# Altium schematic sheet CW341_SRAM.SchDoc: CW341 SRAM
size Letter; Organization: NewAE Technology Inc.; Address1: 1083 Queen St., Suite 196; Address2: Halifax; Address3: NS; Address4: Canada B3H 0B2; SheetNumber: 13; SheetTotal: 15; SheetApproved: NO
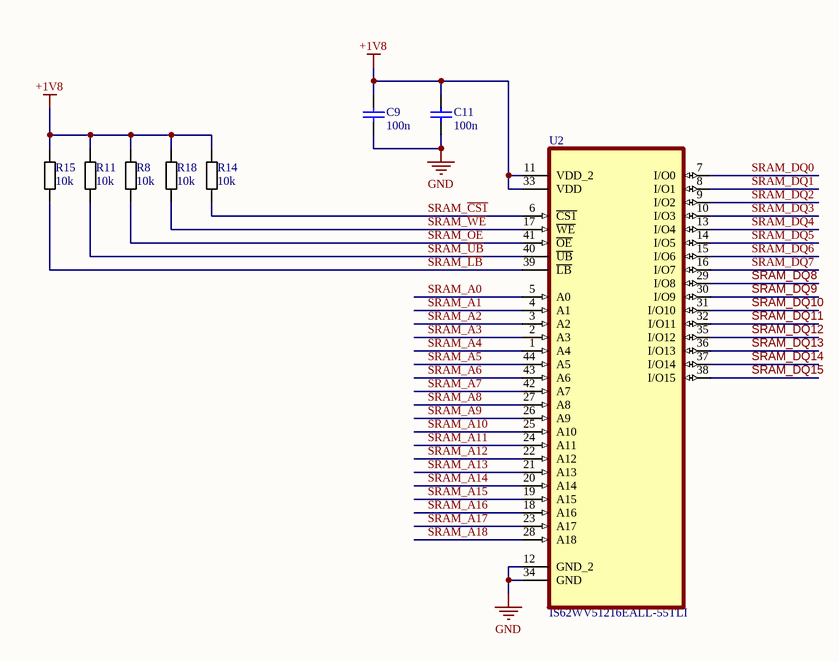
[diagram p0: CW341_SRAM.SchDoc]

## Parts
C9  100n  [CAPC0402_M]
C11  100n  [CAPC0402_M]
R8  10k  [RESC1005X40N]
R11  10k  [RESC1005X40N]
R14  10k  [RESC1005X40N]
R15  10k  [RESC1005X40N]
R18  10k  [RESC1005X40N]
U2  SRAM - 8Mb (1M x 8) Parallel  55ns 44-TSOP II  [TSOP80P1180X120-44M]  (value not drawn)

## Nets
+1V8: C9.1 C11.1 R8.1 R11.1 R14.1 R15.1 R18.1 U2.11(VDD_2) U2.33(VDD)
GND: C9.2 C11.2 U2.12(GND_2) U2.34(GND)
SRAM_A0: U2.5(A0)
SRAM_A1: U2.4(A1)
SRAM_A2: U2.3(A2)
SRAM_A3: U2.2(A3)
SRAM_A4: U2.1(A4)
SRAM_A5: U2.44(A5)
SRAM_A6: U2.43(A6)
SRAM_A7: U2.42(A7)
SRAM_A8: U2.27(A8)
SRAM_A9: U2.26(A9)
SRAM_A10: U2.25(A10)
SRAM_A11: U2.24(A11)
SRAM_A12: U2.22(A12)
SRAM_A13: U2.21(A13)
SRAM_A14: U2.20(A14)
SRAM_A15: U2.19(A15)
SRAM_A16: U2.18(A16)
SRAM_A17: U2.23(A17)
SRAM_A18: U2.28(A18)
SRAM_~{CS1}: R14.2 U2.6(~{CS1})
SRAM_DQ0: U2.7(I/O0)
SRAM_DQ1: U2.8(I/O1)
SRAM_DQ2: U2.9(I/O2)
SRAM_DQ3: U2.10(I/O3)
SRAM_DQ4: U2.13(I/O4)
SRAM_DQ5: U2.14(I/O5)
SRAM_DQ6: U2.15(I/O6)
SRAM_DQ7: U2.16(I/O7)
SRAM_DQ8: U2.29(I/O8)
SRAM_DQ9: U2.30(I/O9)
SRAM_DQ10: U2.31(I/O10)
SRAM_DQ11: U2.32(I/O11)
SRAM_DQ12: U2.35(I/O12)
SRAM_DQ13: U2.36(I/O13)
SRAM_DQ14: U2.37(I/O14)
SRAM_DQ15: U2.38(I/O15)
SRAM_~{LB}: R15.2 U2.39(~{LB})
SRAM_~{OE}: R8.2 U2.41(~{OE})
SRAM_~{UB}: R11.2 U2.40(~{UB})
SRAM_~{WE}: R18.2 U2.17(~{WE})

## Notes on the sheet
- Title:
- Date:
- Rev:
- Time:
- Project:
- Sheet
- of
- License:
- Copyright © NewAE Technology Inc.
- Approved:
- NewAE.com
- File:

## Library data of the parts
C9 C11 = CCHIP-100n-0402: 100n, 0402; Manufacture Part Number 1: CGA2B3X7R1V104K050BB; Component Group: Capacitor; Case-EIA: 0402; Part Number: CCHIP-100n-0402; Footprint: 0402; Pin Count: 2; Value: 100n; Mounting Technology: SMT; Component Kind: Standard; Component Type: Standard; Supplier 1: Digi-Key; Supplier Part Number 1: 445-6901-1-ND
R8 R11 R14 R15 R18 = RCHIP-10K-0402: 10k res, 0402, 1%, 1/16W; Manufacture 1: Yageo; Manufacture Part Number 1: RC0402FR-0710KL; Component Group: Resistor; Case-EIA: 0402; Case-Metric: 1005; Rated Power: 0.063W; Rated Voltage: 75VDC; Part Number: RCHIP-10K-0402; Footprint: 0402; Pin Count: 2; Supplier 1: Digi-Key; Supplier Part Number 1: 311-10.0KLRCT-ND; Value: 10k; Tolerance: 1%; Mounting Technology: SMT; Temperature Range: -55C to 155C; Component Kind: Standard; Component Type: Standard
U2 = IS62WV51216EALL-55TLI: IC SRAM 8M PARALLEL 44TSOP II; Manufacture 1: Alliance Memory; Operating Supply Voltage: 3V; Address Bus Width: 20b; Max Supply Voltage: 2.2V; Min Supply Voltage: 1.65V; Memory Type: RAM,SRAM - Asynchronous,SDR; Max Supply Current: 60mA; Number of Ports: 1; Component Group: Digital IC; PP Material Stack: 0; Supplier 1: Digi-Key; RoHS: Yes; Category: RAM; Stock 1: 1798; Pricing 1: 1=6.76000, 10=6.21600, 25=6.08640, 50=6.06560, 135=5.44252, 270=5.27800, 540=5.01900, 1080=4.84400, 5130=4.35750 (USD); Mount: Surface Mount; Case/Package: TSOP; Number of Pins: 44; Min Operating Temperature: -40°C; Max Operating Temperature: 85°C; Package Quantity: 135; Interface: Parallel; Density: 8Mb; Access Time: 55ns; Packaging: Tray; Memory Size: 8Mb; Length: 18.42mm; Width: 10.16mm; Height: 1mm; Radiation Hardening: No; REACH SVHC: No SVHC; Lead Free: Lead Free; ComponentLink3URL: https://datasheet.ciiva.com/9274/as6c8008-9274921.pdf?src-supplier=Avnet; ComponentLink3Description: https://datasheet.ciiva.com/9274/as6c8008-9274921.pdf?src-supplier=Avnet; ComponentLink4URL: https://datasheet.ciiva.com/1510/32786-1510631.pdf?src-supplier=Element14; ComponentLink4Description: https://datasheet.ciiva.com/1510/32786-1510631.pdf?src-supplier=Element14; Supplier Part Number 1: 1450-1039-ND; .Checked SCH: *; .Checked PCB: *; Part Number: IS62WV51216EALL-55TLI; Footprint: TSSOP-44; Manufacture Part Number 1: IS62WV51216EALL-55TLI; Pin Count: 44; Mounting Technology: SMT; Component Kind: Standard; Component Type: Standard; PP Rotation: 0; Manufacturer Part Number: IS62WV51216EALL-55TLI